# Altium schematic sheet Pwm.SchDoc
size 420 x 297 mm; SheetNumber: 5; SheetTotal: 8
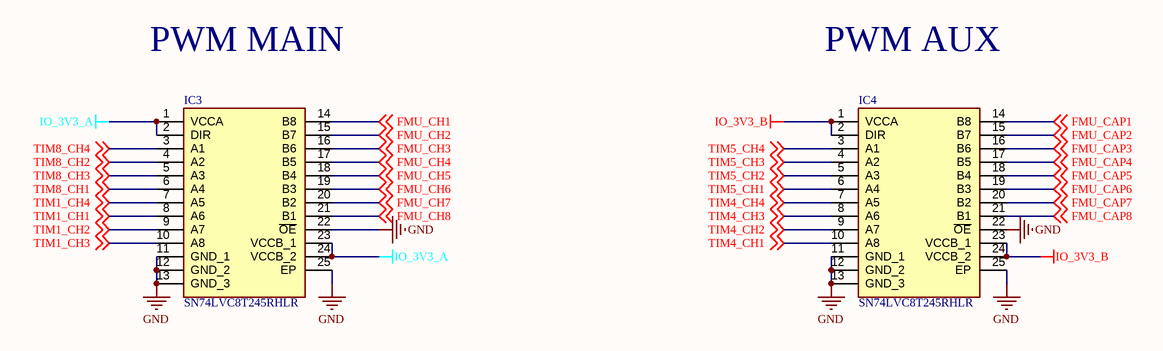
[diagram p0: Pwm.SchDoc]

## Parts
IC3  SN74LVC8T245RHLR  [RHL_(R-PVQFN-N24)]
IC4  SN74LVC8T245RHLR  [RHL_(R-PVQFN-N24)]

## Nets
GND: IC3.11(GND_1) IC3.12(GND_2) IC3.13(GND_3) IC3.22(~{OE}) IC3.25(EP) IC4.11(GND_1) IC4.12(GND_2) IC4.13(GND_3) IC4.22(~{OE}) IC4.25(EP)
IO_3V3_A: IC3.1(VCCA) IC3.2(DIR) IC3.23(VCCB_1) IC3.24(VCCB_2)
IO_3V3_B: IC4.1(VCCA) IC4.2(DIR) IC4.23(VCCB_1) IC4.24(VCCB_2)
FMU_CAP1: IC4.14(B8) ; off-sheet FMU_CAP1
FMU_CAP2: IC4.15(B7) ; off-sheet FMU_CAP2
FMU_CAP3: IC4.16(B6) ; off-sheet FMU_CAP3
FMU_CAP4: IC4.17(B5) ; off-sheet FMU_CAP4
FMU_CAP5: IC4.18(B4) ; off-sheet FMU_CAP5
FMU_CAP6: IC4.19(B3) ; off-sheet FMU_CAP6
FMU_CAP7: IC4.20(B2) ; off-sheet FMU_CAP7
FMU_CAP8: IC4.21(B1) ; off-sheet FMU_CAP8
FMU_CH1: IC3.14(B8) ; off-sheet FMU_CH1
FMU_CH2: IC3.15(B7) ; off-sheet FMU_CH2
FMU_CH3: IC3.16(B6) ; off-sheet FMU_CH3
FMU_CH4: IC3.17(B5) ; off-sheet FMU_CH4
FMU_CH5: IC3.18(B4) ; off-sheet FMU_CH5
FMU_CH6: IC3.19(B3) ; off-sheet FMU_CH6
FMU_CH7: IC3.20(B2) ; off-sheet FMU_CH7
FMU_CH8: IC3.21(B1) ; off-sheet FMU_CH8
TIM1_CH1: IC3.8(A6) ; off-sheet TIM1_CH1
TIM1_CH2: IC3.9(A7) ; off-sheet TIM1_CH2
TIM1_CH3: IC3.10(A8) ; off-sheet TIM1_CH3
TIM1_CH4: IC3.7(A5) ; off-sheet TIM1_CH4
TIM4_CH1: IC4.10(A8) ; off-sheet TIM4_CH1
TIM4_CH2: IC4.9(A7) ; off-sheet TIM4_CH2
TIM4_CH3: IC4.8(A6) ; off-sheet TIM4_CH3
TIM4_CH4: IC4.7(A5) ; off-sheet TIM4_CH4
TIM5_CH1: IC4.6(A4) ; off-sheet TIM5_CH1
TIM5_CH2: IC4.5(A3) ; off-sheet TIM5_CH2
TIM5_CH3: IC4.4(A2) ; off-sheet TIM5_CH3
TIM5_CH4: IC4.3(A1) ; off-sheet TIM5_CH4
TIM8_CH1: IC3.6(A4) ; off-sheet TIM8_CH1
TIM8_CH2: IC3.4(A2) ; off-sheet TIM8_CH2
TIM8_CH3: IC3.5(A3) ; off-sheet TIM8_CH3
TIM8_CH4: IC3.3(A1) ; off-sheet TIM8_CH4

## Notes on the sheet
- PWM MAIN
- PWM AUX
- THIS DOCUMENT AND THE DATA DISCLOSED HEREIN OR
- HEREWITH IS THE PROPERTY OF ALTIUM LIMITED AND MAY
- DWG NO:
- REVISION
- REV:
- DESCRIPTION
- DATE
- APPROVED
- BE FREELY DISTRIBUTED IN WHOLE. NO RIGHTS ARE
- RESERVED OR EXPRESS OR IMPLIED WARANTEE GIVEN.
- ENG:
- APPROVALS
- PROJECT
- DSN:
- CHK:
- REFERENCE DOCUMENTS
- PROJECT REVISION:
- TITLE
- DOCUMENT REVISION:
- DESIGN ITEM:
- BOM:
- FAB DWG:
- PCB DWG:
- ASSY DWG:
- SCALE:
- A3
- SIZE
- CAGE CODE
- FILE NAME
- DWG NO.
- SHEET
- OF
- REV

## Library data of the parts
IC3 IC4 = SN74LVC8T245RHLR: Integrated Circuit; Manufacturer_Name: Texas Instruments; Datasheet Link: http://www.ti.com/lit/gpn/sn74lvc8t245; Manufacturer_Part_Number: SN74LVC8T245RHLR; Mouser Part Number: 595-SN74LVC8T245RHLR; Mouser Price/Stock: https://www.mouser.co.uk/ProductDetail/Texas-Instruments/SN74LVC8T245RHLR?qs=dT9u2OTAaVWMeuErzytHQg%3D%3D; Arrow Part Number: SN74LVC8T245RHLR; Arrow Price/Stock: https://www.arrow.com/en/products/sn74lvc8t245rhlr/texas-instruments?region=nac